# Altium project spycheradrian_csh_charger.PrjPcb
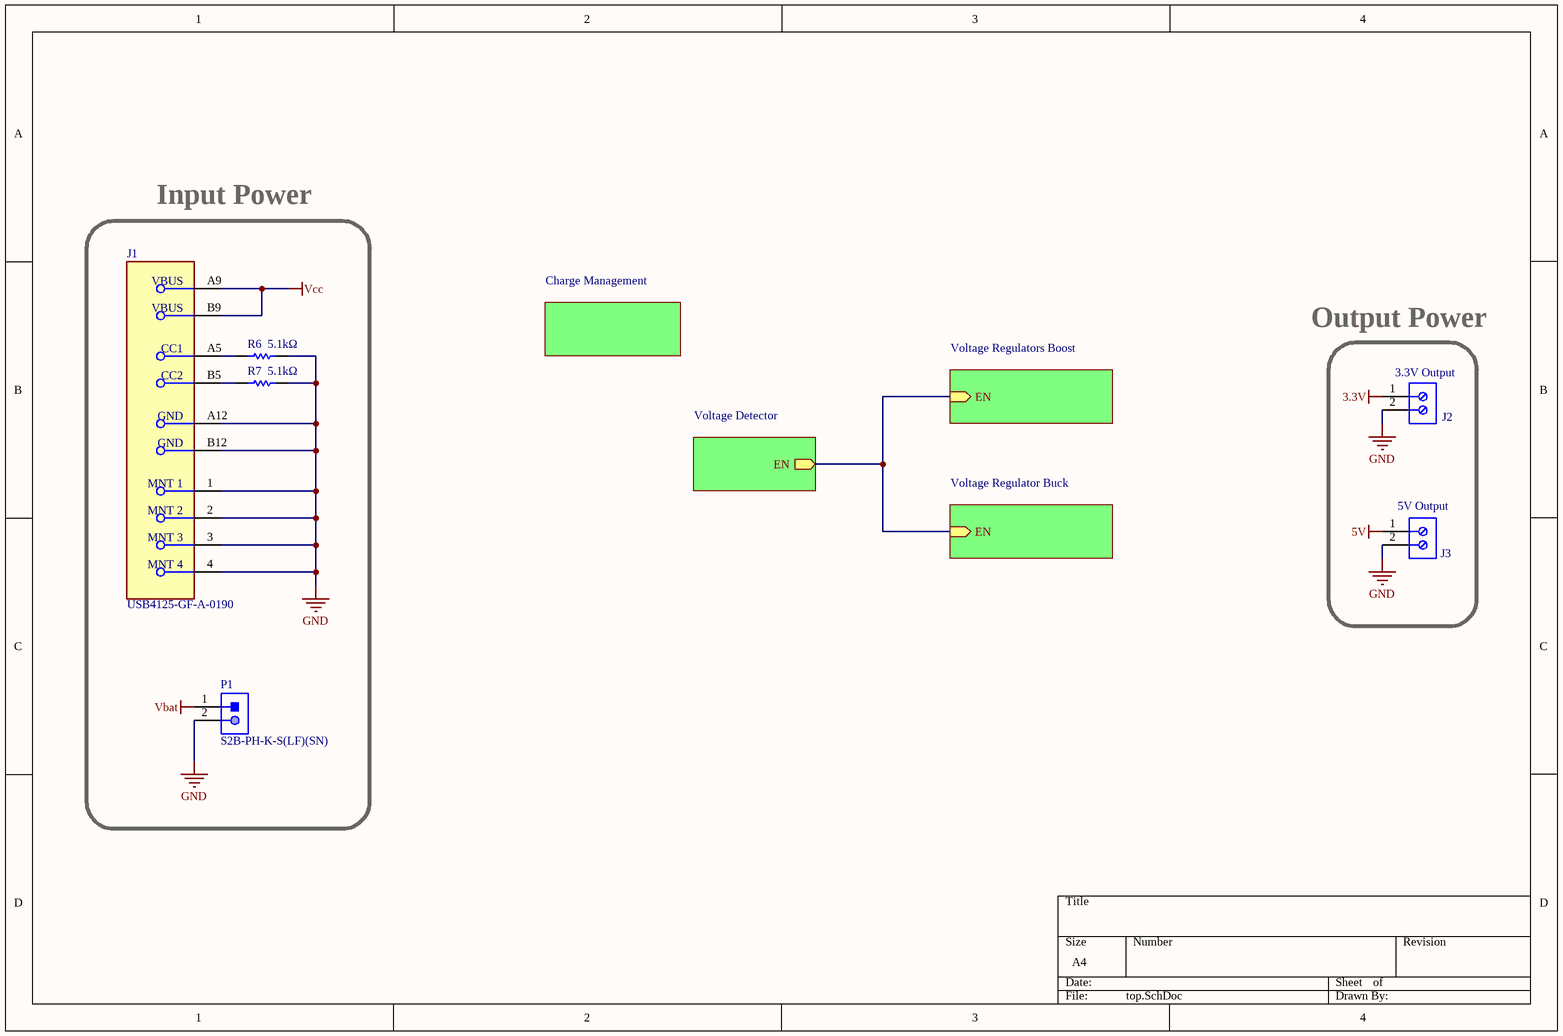
[diagram p0: top.SchDoc]
5 sheets, 33 parts. Net scope: hierarchical (ports join the sheet entries above them; power ports are global).
Board file: PCB1.PcbDoc
Sheets:
  top.SchDoc
    Charge Management = charge_management.SchDoc
    Voltage Regulators Boost = voltage_regulators_boost.SchDoc
    Voltage Regulator Buck = voltage_regulators_buck.SchDoc
    Voltage Detector = voltage_detector.SchDoc

## Sheet top.SchDoc
size A4; SheetNumber: 1; SheetTotal: 5

### Parts
J1  USB4125-GF-A-0190  [FP-USB4125-GF-A-0190-MFG]
J2  3.3V Output  [PHOE-1725656-2]
J3  5V Output  [PHOE-1725656-2]
P1  S2B-PH-K-S(LF)(SN)  [JST-S2B-PH-K-S_V]
R6  5.1kΩ  [RESC1608X55X30LL15T15]
R7  5.1kΩ  [RESC1608X55X30LL15T15]

### Sub-sheets
Charge Management = charge_management.SchDoc: no entries
Voltage Detector = voltage_detector.SchDoc: EN (out)
Voltage Regulator Buck = voltage_regulators_buck.SchDoc: EN (in)
Voltage Regulators Boost = voltage_regulators_boost.SchDoc: EN (in)

### Nets
3.3V: J2.1
5V: J3.1
GND: J1.1(MNT_1) J1.2(MNT_2) J1.3(MNT_3) J1.4(MNT_4) J1.A12(GND) J1.B12(GND) J2.2 J3.2 P1.2 R6.2 R7.2
Vbat: P1.1
Vcc: J1.A9(VBUS) J1.B9(VBUS)
NetJ1_A5: J1.A5(CC1) R6.1
NetJ1_B5: J1.B5(CC2) R7.1
NetU2_1: sheet Voltage Regulators Boost/EN, sheet Voltage Regulator Buck/EN, sheet Voltage Detector/EN

### Notes on the sheet
- Input Power
- Output Power

### Library data of the parts
J1 = CMP-245163-000004-1: CONN RCPT TYPE C 6P SMD RA
J2 J3 = CMP-2000-05299-1: Male Header, Pitch 2.54 mm, 1 x 2 Position, Height 9 mm, Tail Length 3.5 mm; Manufacturer part No.: 1725656; Manufacturer: Phoenix Contact; Number of contacts: 2; Content: 250pc(s); Pitch: 2.54mm; Industrial packaging: Yes; Colour: Green; Type: MPT0,5/2-2,54; Datasheet URL: http://datasheet.octopart.com/1725656-Phoenix-Contact-datasheet-5302866.pdf; Manufacturer URL: http://www.phoenixcontact.com/; Datasheet Version: Apr-08
P1 = CMP-1755-00004-1: Male Header, Pitch 2 mm, 1 x 2 Position, Height 4.8 mm, Tail Length 3.4 mm, -25 to 85 degC, RoHS, Bulk; Case\Package: Radial; Tolerance: 20%; Capacitance: 10 uF; Voltage Rating (DC): 50 V; Packaging: Bulk; ComponentLink1URL: http://www.jst-mfg.com/product/pdf/eng/ePH.pdf; Radiation Hardening: No; Height: 11 mm; Package Quantity: 200; PackageDescription: Male Header, Pitch 2 mm, 1 x 2 Position, Height 4.8 mm, Tail Length 3.4 mm; PackageReference: S2B-PH-K-S; Diameter: 5 mm; Pins: 2; Mount: Through Hole; Max Operating Temperature: 85 degC; Min Operating Temperature: -40 degC; ComponentLink1Description: Datasheet; DatasheetVersion: Dec-12; Length: 11 mm; Lead Pitch: 2 mm; REACH SVHC: No SVHC; Voltage Rating: 50 V; RoHSCompliant: true
R6 R7 = CMP-2000-00803-1: Part Number: ERJ-3GEYJ512V; Manufacturer: Panasonic

## Sheet charge_management.SchDoc
size A4; SheetNumber: 3; SheetTotal: 5
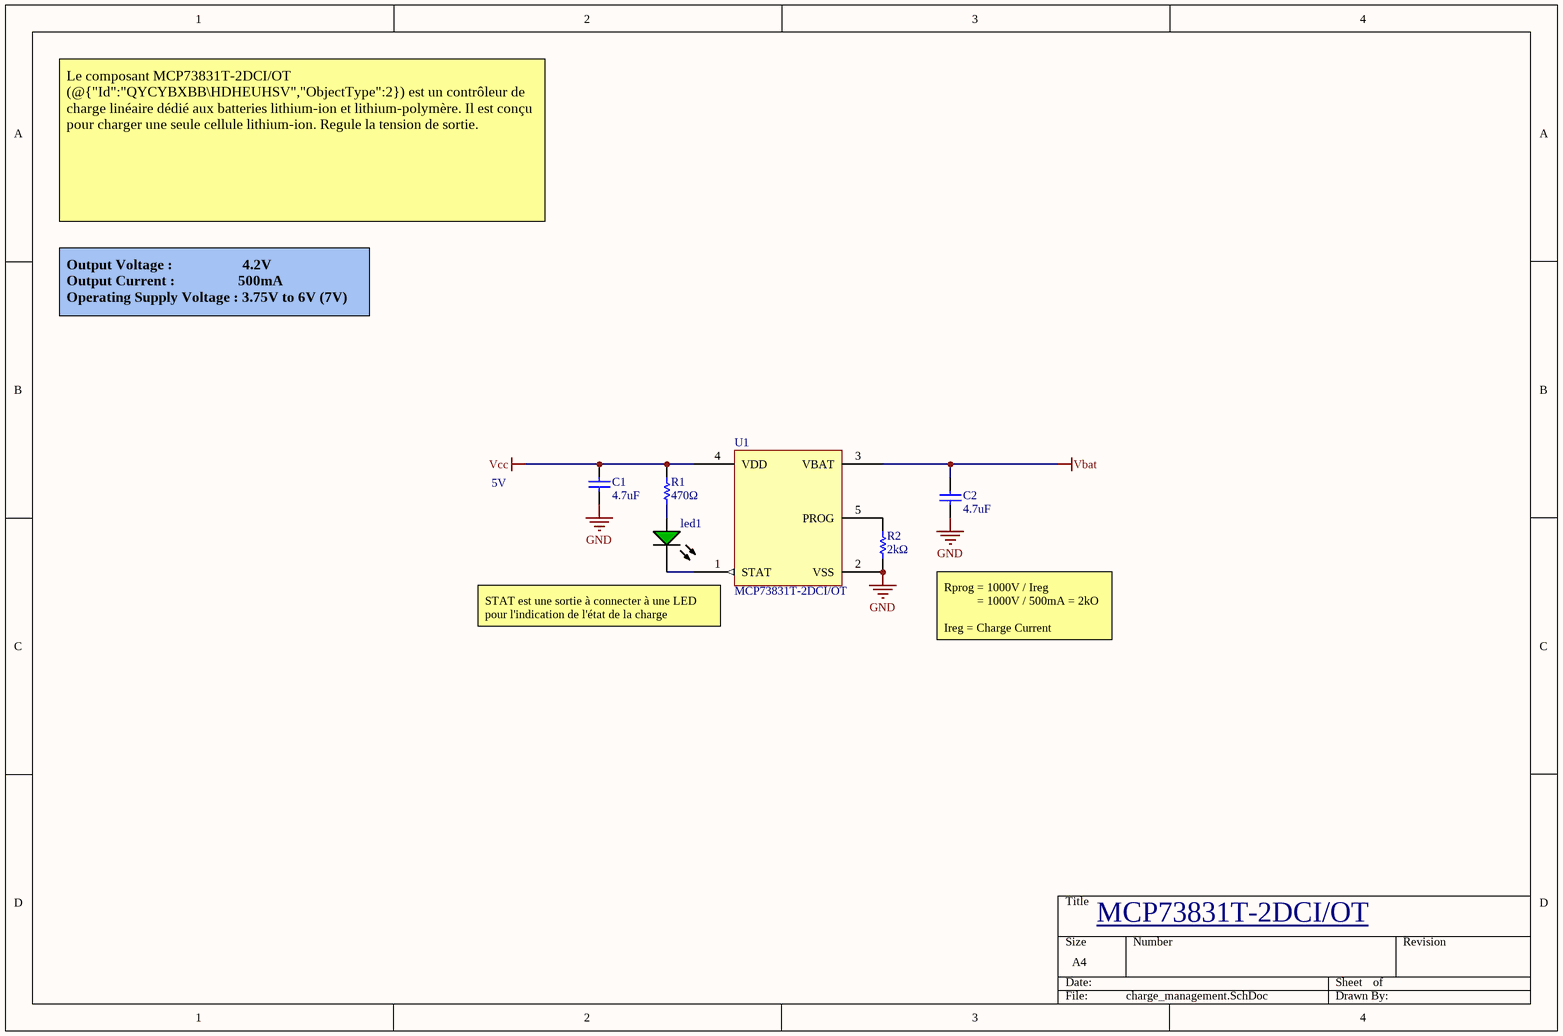
[diagram p1: charge_management.SchDoc]

### Parts
C1  4.7uF  [CAPC0603(1608)100_M]
C2  4.7uF  [CAPC0603(1608)100_M]
led1  598-8070-107F  [DIAL-0603-2_V]  (value not drawn)
R1  470Ω  [RESC1608X55X30NL15T15]
R2  2kΩ  [RESC1608X55X30ML15T15]
U1  MCP73831T-2DCI/OT  [MCP73831T-2DCI/OT]

### Nets
GND: C1.1 C2.1 R2.1 U1.2(VSS)
Vbat: C2.2 U1.3(VBAT)
Vcc: C1.2 R1.2 U1.4(VDD)
Netled1_1: led1.1(K) U1.1(STAT)
Netled1_2: led1.2(A) R1.1
NetR2_2: R2.2 U1.5(PROG)

### Notes on the sheet
- Le composant MCP73831T-2DCI/OT (@{"Id":"QYCYBXBB\HDHEUHSV","ObjectType":2}) est un contrôleur de charge linéaire dédié aux batteries lithium-ion et lithium-polymère. Il est conçu pour charger une seule cellule lithium-ion. Regule la tension de sortie.
- Output Voltage :                    4.2V
  Output Current :                  500mA
  Operating Supply Voltage : 3.75V to 6V (7V)
- 5V
- (near U1) STAT est une sortie à connecter à une LED pour l'indication de l'état de la charge
- Rprog = 1000V / Ireg
  = 1000V / 500mA = 2kO
  Ireg = Charge Current
- MCP73831T-2DCI/OT <https://www.mouser.ch/ProductDetail/Microchip-Technology/MCP73831T-2DCI-OT?qs=yUQqVecv4qu38ml9qkvsJw%3D%3D>

### Library data of the parts
C1 C2 = CMP-1035-02783-1: CAP 4.7uF 6.3V -20% to +80% 0603 (1608 Metric) Thickness 1mm SMD; Case-Metric: 1608; Case-EIA: 0603; Tolerance: -20% to +80%; Rated Voltage: 6.3 V; Value: 4.7uF; Technology: SMT; Max Thickness: 1 mm
led1 = CMP-2000-05654-1: Single Color LED, 2 V, -30 to 85 degC, 2-Pin SMD (0603), RoHS, Tape and Reel; Manufacturer: Dialight; Power Dissipation: 60W; DELETED: Compliant; Number of  Elements: 1; Viewing Angle: 140deg; Dominant Wave Length: 568nm; Product Depth (mm): 0.8mm; Emitting Color: YellowGreen; Main Category: ChipLED; Product Length (mm): 1.6mm; Type: Uni-Color; Forward Voltage: 2.4V; Luminous Intensity: 20mcd; High Brightness: No; Forward Current: 25mA; Test Current (It): 20mA; Shape Type: Rectangular; Reverse Voltage: 5V; Product Height (mm): 0.7mm; Chip Material: GaP; Mounting: SurfaceMount; Package Description: 2-Pin Surface Mount Device, Body 1.6 x 0.8 mm; Package Type: SMD; Operating Temperature Classification: Industrial; Package Reference: 0603; Datasheet Version: Rev. 2, 10/2008; Lens Dimensions: 1.1x0.8x0.4mm; Pin Count: 2; Manufacturer URL: http://www.dialight.com/; Mounting Technology: SurfaceMount; Operating Temp Range: -40Cto100C; Packaging: TapeandReel; Rad Hardened: No; Datasheet URL: https://datasheet.ciiva.com/4688/598-selectorguide-18902-4688880.pdf; Lum Intensity: 20mcd
R1 = CMP-2000-00795-1: Part Number: ERJ-3GEYJ471V; Manufacturer: Panasonic
R2 = CMP-2000-00317-1: Part Number: ERJ-3EKF2001V; Manufacturer: Panasonic

## Sheet voltage_regulators_boost.SchDoc
size A4; SheetNumber: 4; SheetTotal: 5
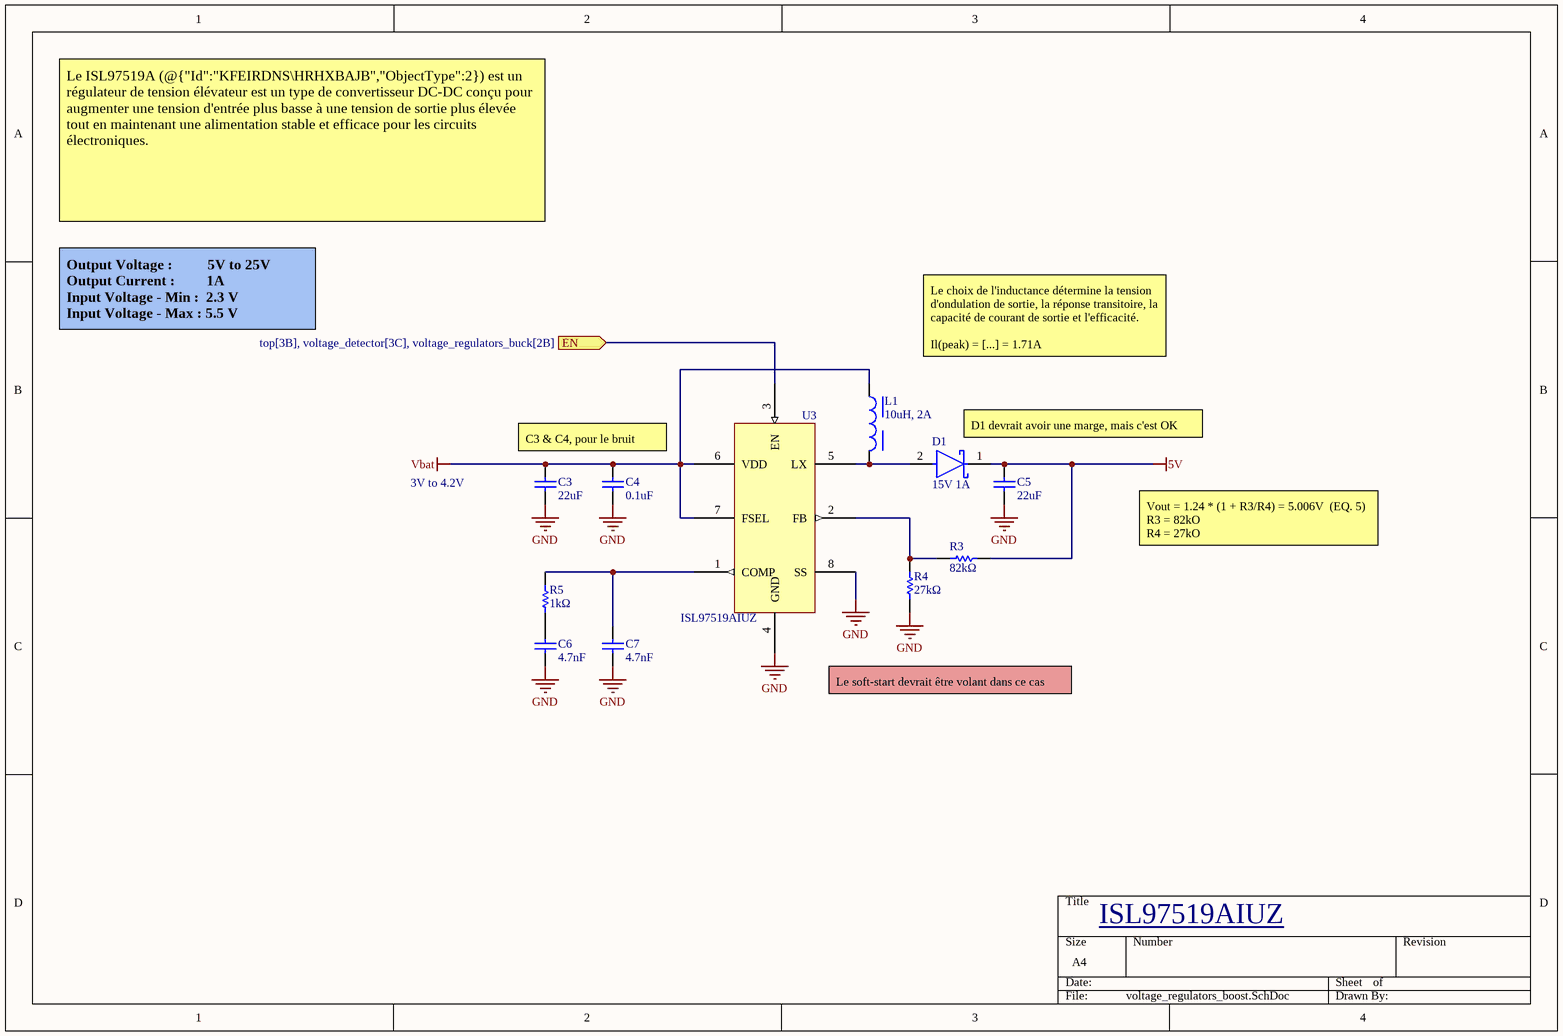
[diagram p2: voltage_regulators_boost.SchDoc]

### Parts
C3  22uF  [CAPC1608X90X35ML10T15]
C4  0.1uF  [CAPC1608X90X35LL15T15]
C5  22uF  [CAPC1608X90X35ML10T15]
C6  4.7nF  [CAPC1608X90X35ML10T15]
C7  4.7nF  [CAPC1608X90X35ML10T15]
D1  15V 1A  [FP-DO-214BA-IPC_C]
L1  10uH, 2A  [WE-MAIA_3015]
R3  82kΩ  [RESC1608X55X25LL10T15]
R4  27kΩ  [RESC1608X55X25LL10T15]
R5  1kΩ  [RESC1609X50X30LL10T20]
U3  ISL97519AIUZ  [ISL97519AIUZ]

### Ports
EN (in, see top[3B], voltage_detector[3C], voltage_regulators_buck[2B])

### Nets
5V: C5.2 D1.1(C) R3.1
GND: C3.1 C4.1 C5.1 C6.1 C7.1 R4.2 U3.4(GND) U3.8(SS)
Vbat: C3.2 C4.2 L1.1 U3.6(VDD) U3.7(FSEL)
NetC6_2: C6.2 R5.1
NetC7_2: C7.2 R5.2 U3.1(COMP)
NetD1_2: D1.2(A) L1.2 U3.5(LX)
NetR3_2: R3.2 R4.1 U3.2(FB)
NetU2_1: U3.3(EN) ; port EN

### Notes on the sheet
- Le ISL97519A (@{"Id":"KFEIRDNS\HRHXBAJB","ObjectType":2}) est un régulateur de tension élévateur est un type de convertisseur DC-DC conçu pour augmenter une tension d'entrée plus basse à une tension de sortie plus élevée tout en maintenant une alimentation stable et efficace pour les circuits électroniques.
- Output Voltage :          5V to 25V
  Output Current :         1A
  Input Voltage - Min :  2.3 V
  Input Voltage - Max : 5.5 V
- Le choix de l'inductance détermine la tension d'ondulation de sortie, la réponse transitoire, la capacité de courant de sortie et l'efficacité.
  Il(peak) = [...] = 1.71A
- C3 & C4, pour le bruit
- D1 devrait avoir une marge, mais c'est OK
- 3V to 4.2V
- Vout = 1.24 * (1 + R3/R4) = 5.006V  (EQ. 5)
  R3 = 82kO
  R4 = 27kO
- Le soft-start devrait être volant dans ce cas
- ISL97519AIUZ <https://www.mouser.ch/ProductDetail/Renesas-Intersil/ISL97519AIUZ?qs=sGAEpiMZZMvAX9OfPh%252B2NdrUzpYIC9WFoHZg1f2cJ9g%3D>

### Library data of the parts
C3 C5 = CMP-2006-02789-1: Part Number: GRM188R60G226MEA0L; Manufacturer: Murata
C4 = CMP-2006-02168-1: Manufacturer: AVX Interconnect / Elco; Part Number: LD035C104KAB2A
C6 C7 = CMP-2006-02924-1: Part Number: GRM188R71H472KA01D; Manufacturer: Murata
D1 = CMP-2000-06604-2: LSM115JE3/TR13 DIODE SCHOTTKY 15V 1A DO214BA; Manufacturer: Microsemi; Capacitance: 150pF; Peak Reverse Current: 10mA; Value: 150pF; Max Junction Temp: +100°C; Standoff Height: 0.01mm; Max Surge Forward Current: 50A; Device Class L2: Diodes; Automotive: No; Forward Current: 1A; ComponentLink2URL: https://media.digikey.com/pdf/Data%20Sheets/Microsemi%20PDFs/LSM115J.pdf; Max Repetitive Reverse Voltage: 15V; Mouser Description: Schottky Diodes & Rectifiers Schottky Rectifier; Device Class L3: Rectifier Diodes; Footprint Url: https://www.microsemi.com/packaging-information/partpackage/details?pid=5147; Octopart: https://octopart.com/lsm115je3%2Ftr13-microsemi-17743343; Category: Diode; Height: 2.92mm; RoHS: TRUE; Device Class L1: Discrete Semiconductors; Manufacturer Part Number: LSM115JE3/TR13; Lead Free: Yes; Temperature Range High: +100°C; ComponentLink2Description: Datasheet; Package: DO-214BA; Digikey Description: DIODE SCHOTTKY 15V 1A DO214BA; Temperature Range Low: -55°C; Temperature: -55°C to +100°C; Reverse Voltage: 15V
L1 = CMP-03913-56466825-2: 78438335100 Inductor, Aec-Q200, 10Uh, Shielded/0.85A Rohs Compliant: Yes; Core Material: Ferrite; Tolerance: 30%; Current Rating: 850mA; Test Frequency: 100kHz; DC Resistance (DCR): 446mΩ; Self Resonant Frequency: 21MHz; Inductance: 10µH; Width: 3mm; Ambient Temperature Range High: 85°C; Ambient Temperature Range Low: -40°C; Composition: Wirewound; Height: 1.5mm; Mount: Surface Mount; Saturation Current: 2A; NexarPartId: 56466825; Length: 3mm; Number of Pins: 2; Shielding: Shielded; Min Operating Temperature: -40°C; Height - Seated (Max): 1.4986mm; Case/Package: 1212; Ratings: AEC-Q200; Case Code (Imperial): 1212; Max Operating Temperature: 125°C; RoHS: Compliant; Case Code (Metric): 3030
R3 = CMP-2000-06947-1: Chip Resistor, 82 KOhm, +/- 1%, 0.1 W, -55 to 155 degC, 0603 (1608 Metric), RoHS, Tape and Reel; Manufacturer: Yageo; Temperature Coefficient: 100PPM/C; Unit Weight: 0.000071oz; Voltage Rating: 75V; Resistance: 82kOhms; Power Rating: 100mW; Packaging: Reel; Package Description: 2-Pin Surface Mount Device, Body 1.6 x 0.8 mm; Package / Case: 0603(1608metric); Series: RC; Operating Temperature Range: -55Cto+155C; Brand: Yageo; Case Code - in: 0603; Width: 0.8mm; Height: 0.45mm; Product Category: ThickFilmResistors; Length: 1.6mm; Product: ThickFilmResistorsGeneralPurpose; Manufacturer URL: http://www.yageo.com/; Datasheet URL: http://www.yageo.com/documents/recent/PYu-RC_Group_51_RoHS_L_7.pdf; RoHS: True; Datasheet Version: Rev. 7, 05/2017; Tolerance: 1%; Case Code - mm: 1608; Package Reference: 0603; Mounting Technology: SurfaceMount; Type: GeneralPurposeChipResistorSurfaceMount; Termination Style: SMD/SMT
R4 = CMP-2000-06933-1: Chip Resistor, 27 KOhm, +/- 1%, 0.1 W, -55 to 155 degC, 0603 (1608 Metric), RoHS, Tape and Reel; Manufacturer: Yageo; Resistance: 27kOhms; Temperature Coefficient: 100PPM/C; Power Rating: 100mW; Voltage Rating: 50V; Mounting Technology: SurfaceMount; Operating Temperature Range: -55Cto+155C; Case Code - in: 0603; Product: ThickFilmResistorsGeneralPurpose; Package Reference: 0603; Datasheet Version: Rev. 7, 05/2017; Tolerance: 1%; Manufacturer URL: http://www.yageo.com/; Termination Style: SMD/SMT; Packaging: Reel; Series: RC; Package Description: 2-Pin Surface Mount Device, Body 1.6 x 0.8 mm; Datasheet URL: http://www.yageo.com/documents/recent/PYu-RC_Group_51_RoHS_L_7.pdf; Case Code - mm: 1608
R5 = CMP-2000-02972-1: Manufacturer: Vishay Dale; Part Number: CRCW06031K00FKEC

## Sheet voltage_regulators_buck.SchDoc
size A4; SheetNumber: 5; SheetTotal: 5
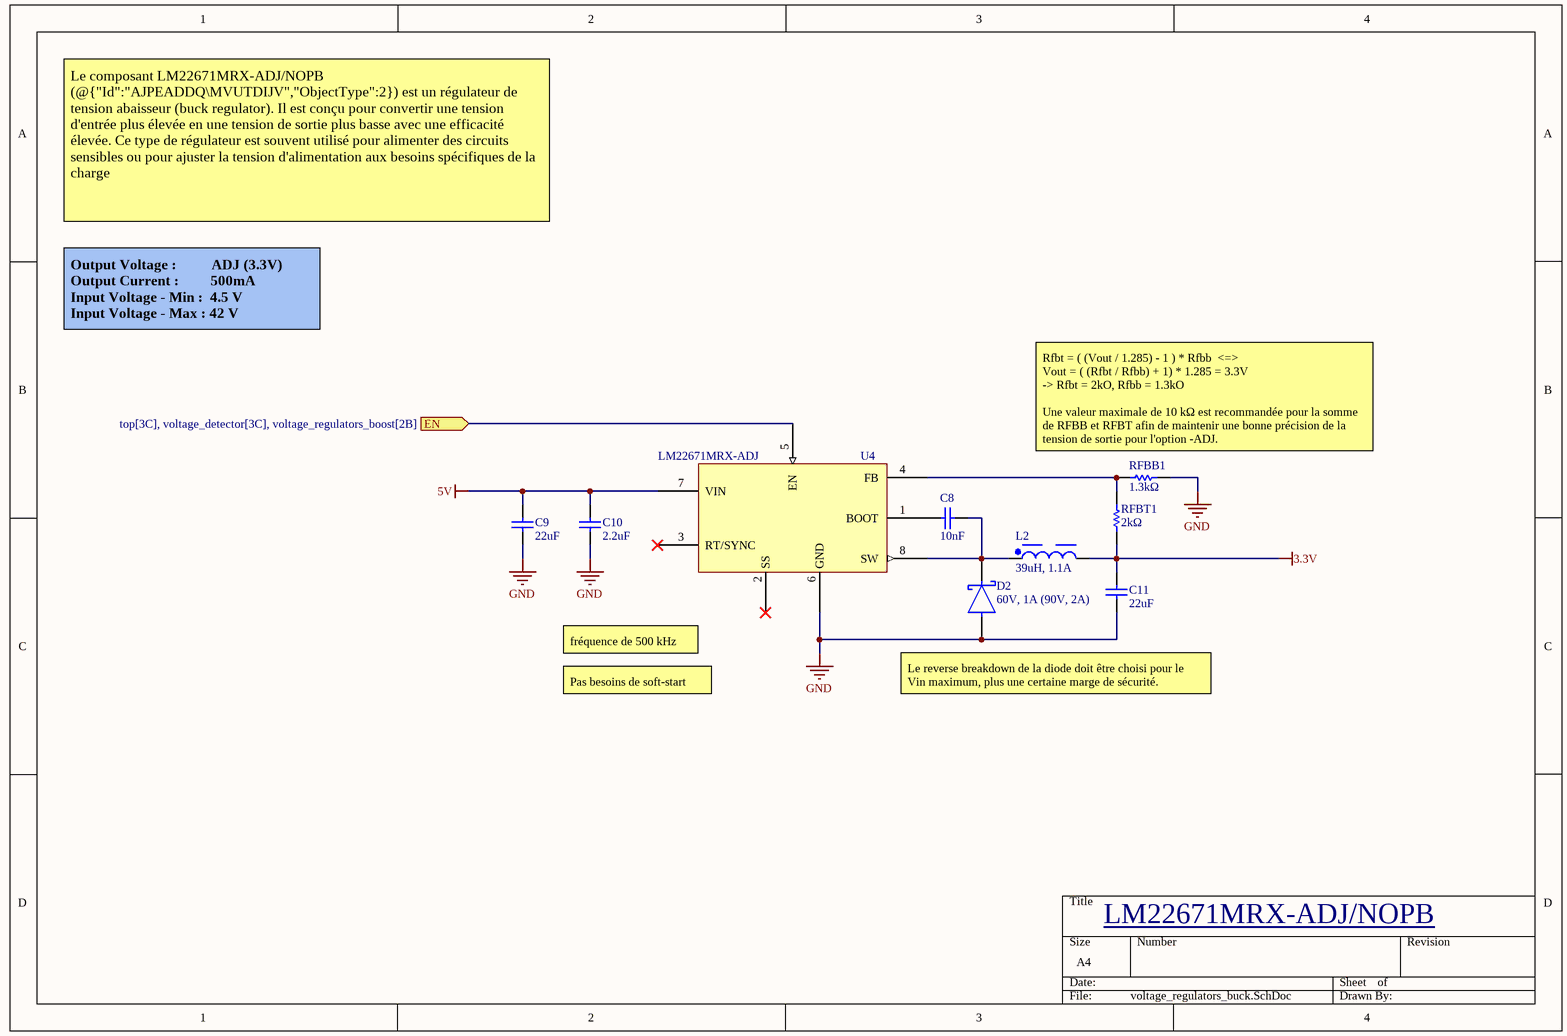
[diagram p3: voltage_regulators_buck.SchDoc]

### Parts
C8  10nF  [CAPC1608X90X35ML10T15]
C9  22uF  [CAPC1608X90X35ML10T15]
C10  2.2uF  [CAPC1608X90X35NL15T15]
C11  22uF  [CAPC1608X90X35ML10T15]
D2  60V, 1A (90V, 2A)  [FP-SMB-MFG]
L2  39uH, 1.1A  [WE-PD_7332R]
RFBB1  1.3kΩ  [RESC1609X50X30NL10T20]
RFBT1  2kΩ  [RESC1608X55X30ML15T15]
U4  LM22671MRX-ADJ  [LM22671MRX-ADJ/NOPB]

### Ports
EN (in, see top[3C], voltage_detector[3C], voltage_regulators_boost[2B])

### Nets
3.3V: C11.2 L2.2 RFBT1.1
5V: C9.2 C10.2 U4.7(VIN)
GND: C9.1 C10.1 C11.1 D2.2(A) RFBB1.2 U4.6(GND)
NetC8_1: C8.1 U4.1(BOOT)
NetC8_2: C8.2 D2.1(C) L2.1 U4.8(SW)
NetRFBB1_1: RFBB1.1 RFBT1.2 U4.4(FB)
NetU2_1: U4.5(EN) ; port EN

Not connected (* = marked no-connect by the designer): U4 2(SS)* 3(RT/SYNC)*

### Notes on the sheet
- Le composant LM22671MRX-ADJ/NOPB (@{"Id":"AJPEADDQ\MVUTDIJV","ObjectType":2}) est un régulateur de tension abaisseur (buck regulator). Il est conçu pour convertir une tension d'entrée plus élevée en une tension de sortie plus basse avec une efficacité élevée. Ce type de régulateur est souvent utilisé pour alimenter des circuits sensibles ou pour ajuster la tension d'alimentation aux besoins spécifiques de la charge
- Output Voltage :          ADJ (3.3V)
  Output Current :         500mA
  Input Voltage - Min :  4.5 V
  Input Voltage - Max : 42 V
- (near RFBB1) Rfbt = ( (Vout / 1.285) - 1 ) * Rfbb  <=>
  Vout = ( (Rfbt / Rfbb) + 1) * 1.285 = 3.3V
  -> Rfbt = 2kO, Rfbb = 1.3kO
  Une valeur maximale de 10 kΩ est recommandée pour la somme de RFBB et RFBT afin de maintenir une bonne précision de la tension de sortie pour l'option -ADJ.
- fréquence de 500 kHz
- Pas besoins de soft-start
- Le reverse breakdown de la diode doit être choisi pour le Vin maximum, plus une certaine marge de sécurité.
- LM22671MRX-ADJ/NOPB <https://www.mouser.ch/ProductDetail/Texas-Instruments/LM22671MRX-ADJ-NOPB?qs=X1J7HmVL2ZGHbJs9hwNu1Q%3D%3D>

### Library data of the parts
C8 = CMP-2100-03642-1: Chip Capacitor, 10 nF, +/- 10%, 50 V, -55 to 125 degC, 0603 (1608 Metric), RoHS, Tape and Reel; Manufacturer: Murata; Insulation Resistance: 10GR; Dielectric: X7R; Voltage Rating: 50V; Material: Ceramic; Package Quantity: 1; Lead Free: LeadFree; Case/Package: 0603; Termination: SMD/SMT; REACH SVHC: Unknown; Manufacturer URL: http://www.murata.com/; Datasheet URL: http://search.murata.co.jp/Ceramy/image/img/A01X/G101/ENG/GRM188R71H103KA01-01.pdf; Mount: SurfaceMount; Datasheet Version: 42401.0; Number of Pins: 2; Length: 1.6mm; Voltage: 50V; Depth: 0.8mm; Tolerance: 10%; Min Operating Temperature: -55degC; Voltage Rating (DC): 50V; Max Operating Temperature: 125degC; Package Description: 2-Pin Surface Mount Device, Body 1.6 x 0.8 mm; RoHSCompliant: True; Case Code (Imperial): 0603; Width: 0.031inch; Case Code (Metric): 1608; Height: 0.8mm; Package Reference: 0603; Packaging: TapeandReel; Thickness: 0.035inch; Capacitance: 10nF; Dielectric Material: Ceramic
C9 C11 = CMP-2006-02789-1: as C3 on sheet voltage_regulators_boost
C10 = CMP-2006-04537-1: Manufacturer: AVX Interconnect / Elco; Part Number: 0603YD225MAT2A
D2 = CMP-12790-000073-1: DIODE SCHOTTKY 60V 1A SMB; Forward Voltage: 700mV; Capacitance: 110pF; Polarity: Standard; Max Forward Surge Current (Ifsm): 30A; Element Configuration: Single; Peak Reverse Current: 500uA; Height: 2.42mm; Radiation Hardening: No; Length: 4.57mm; Max Repetitive Reverse Voltage (Vrrm): 60V; Current Rating: 1A; Width: 3.94mm; Min Operating Temperature: -65°C; Max Operating Temperature: 150°C; Weight: 0.00328oz; Forward Current: 1A; Number of Pins: 2; Mount: Surface Mount; Lead Free: Lead Free; Case/Package: SMB; Contact Plating: Tin; Voltage Rating (DC): 60V; Average Rectified Current: 1A; Package Quantity: 3000; Max Reverse Voltage (DC): 60V; Output Current: 1A; REACH SVHC: No SVHC; Packaging: Tape and Reel; Termination: SMD/SMT; Peak Non-Repetitive Surge Current: 30A
L2 = CMP-1396-00047-2: NexarPartId: 22866977; Shielding: Shielded; RMS Current (Irms): 1.03A; Tolerance: 20%; Test Frequency: 1kHz; Core Material: Ferrite; DC Resistance (DCR): 209mΩ; Resistance: 320mΩ; Self Resonant Frequency: 15MHz; Inductance: 39µH; Termination: SMD/SMT; Composition: Wirewound; Number of Pins: 2; Ambient Temperature Range Low: -40°C; Max DC Current: 1.03A; Inductance Tolerance: 20%; Length: 7.3mm; Saturation Current: 1.1A; Packaging: Cut Tape (CT); Ambient Temperature Range High: 85°C; Current Rating: 1.03A; Min Operating Temperature: -40°C; Max Operating Temperature: 125°C; Height - Seated (Max): 3.5052mm; Case/Package: Nonstandard; Width: 7.3mm; Height: 3.2mm; Series Resistance: 320mΩ; REACH SVHC: Unknown; RoHS: Compliant; Mount: Surface Mount
RFBB1 = CMP-2000-02988-1: Manufacturer: Vishay Dale; Part Number: CRCW06031K30FKEA
RFBT1 = CMP-2000-00317-1: as R2 on sheet charge_management

## Sheet voltage_detector.SchDoc
size A4; SheetNumber: 2; SheetTotal: 5
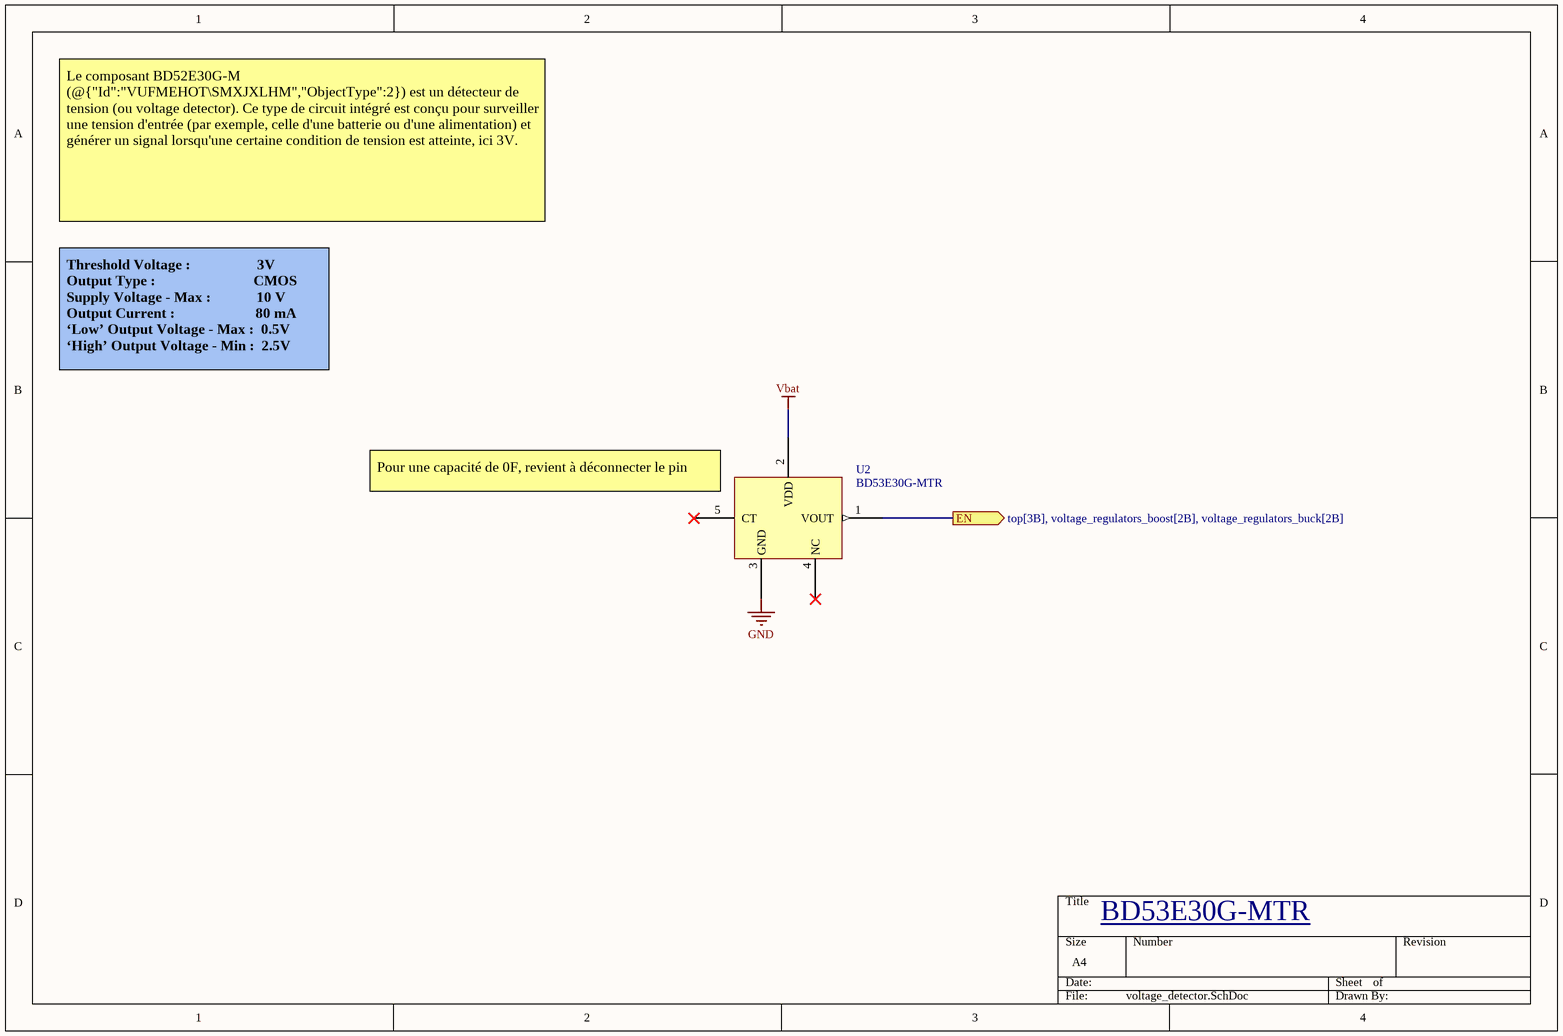
[diagram p4: voltage_detector.SchDoc]

### Parts
U2  BD53E30G-MTR  [BD53E30G-MTR]

### Ports
EN (out, see top[3B], voltage_regulators_boost[2B], voltage_regulators_buck[2B])

### Nets
GND: U2.3(GND)
Vbat: U2.2(VDD)
NetU2_1: U2.1(VOUT) ; port EN

Not connected (* = marked no-connect by the designer): U2 4(NC)* 5(CT)*

### Notes on the sheet
- Le composant BD52E30G-M (@{"Id":"VUFMEHOT\SMXJXLHM","ObjectType":2}) est un détecteur de tension (ou voltage detector). Ce type de circuit intégré est conçu pour surveiller une tension d'entrée (par exemple, celle d'une batterie ou d'une alimentation) et générer un signal lorsqu'une certaine condition de tension est atteinte, ici 3V.
- Threshold Voltage :                   3V
  Output Type :                            CMOS
  Supply Voltage - Max :             10 V
  Output Current :                       80 mA
  ‘Low’ Output Voltage - Max :  0.5V
  ‘High’ Output Voltage - Min :  2.5V
- (near U2) Pour une capacité de 0F, revient à déconnecter le pin
- BD53E30G-MTR <https://www.mouser.ch/ProductDetail/ROHM-Semiconductor/BD53E30G-MTR?qs=WHeKGGBt0W8BsyUIHW4eRw%3D%3D>

## Nets that join several sheets
3.3V: top (J2.1), voltage_regulators_buck (C11.2 L2.2 RFBT1.1)
5V: top (J3.1), voltage_regulators_boost (C5.2 D1.1 R3.1), voltage_regulators_buck (C9.2 C10.2 U4.7)
GND: top (11 pins), charge_management (C1.1 C2.1 R2.1 U1.2), voltage_regulators_boost (8 pins), voltage_regulators_buck (6 pins), voltage_detector (U2.3)
Vbat: top (P1.1), charge_management (C2.2 U1.3), voltage_regulators_boost (5 pins), voltage_detector (U2.2)
Vcc: top (J1.A9 J1.B9), charge_management (C1.2 R1.2 U1.4)
NetU2_1: voltage_regulators_boost (U3.3), voltage_regulators_buck (U4.5), voltage_detector (U2.1)